# EAGLE design PCB_ESP32_v19_IMPRIMIR_COBRE (EAGLE 9.7.0)
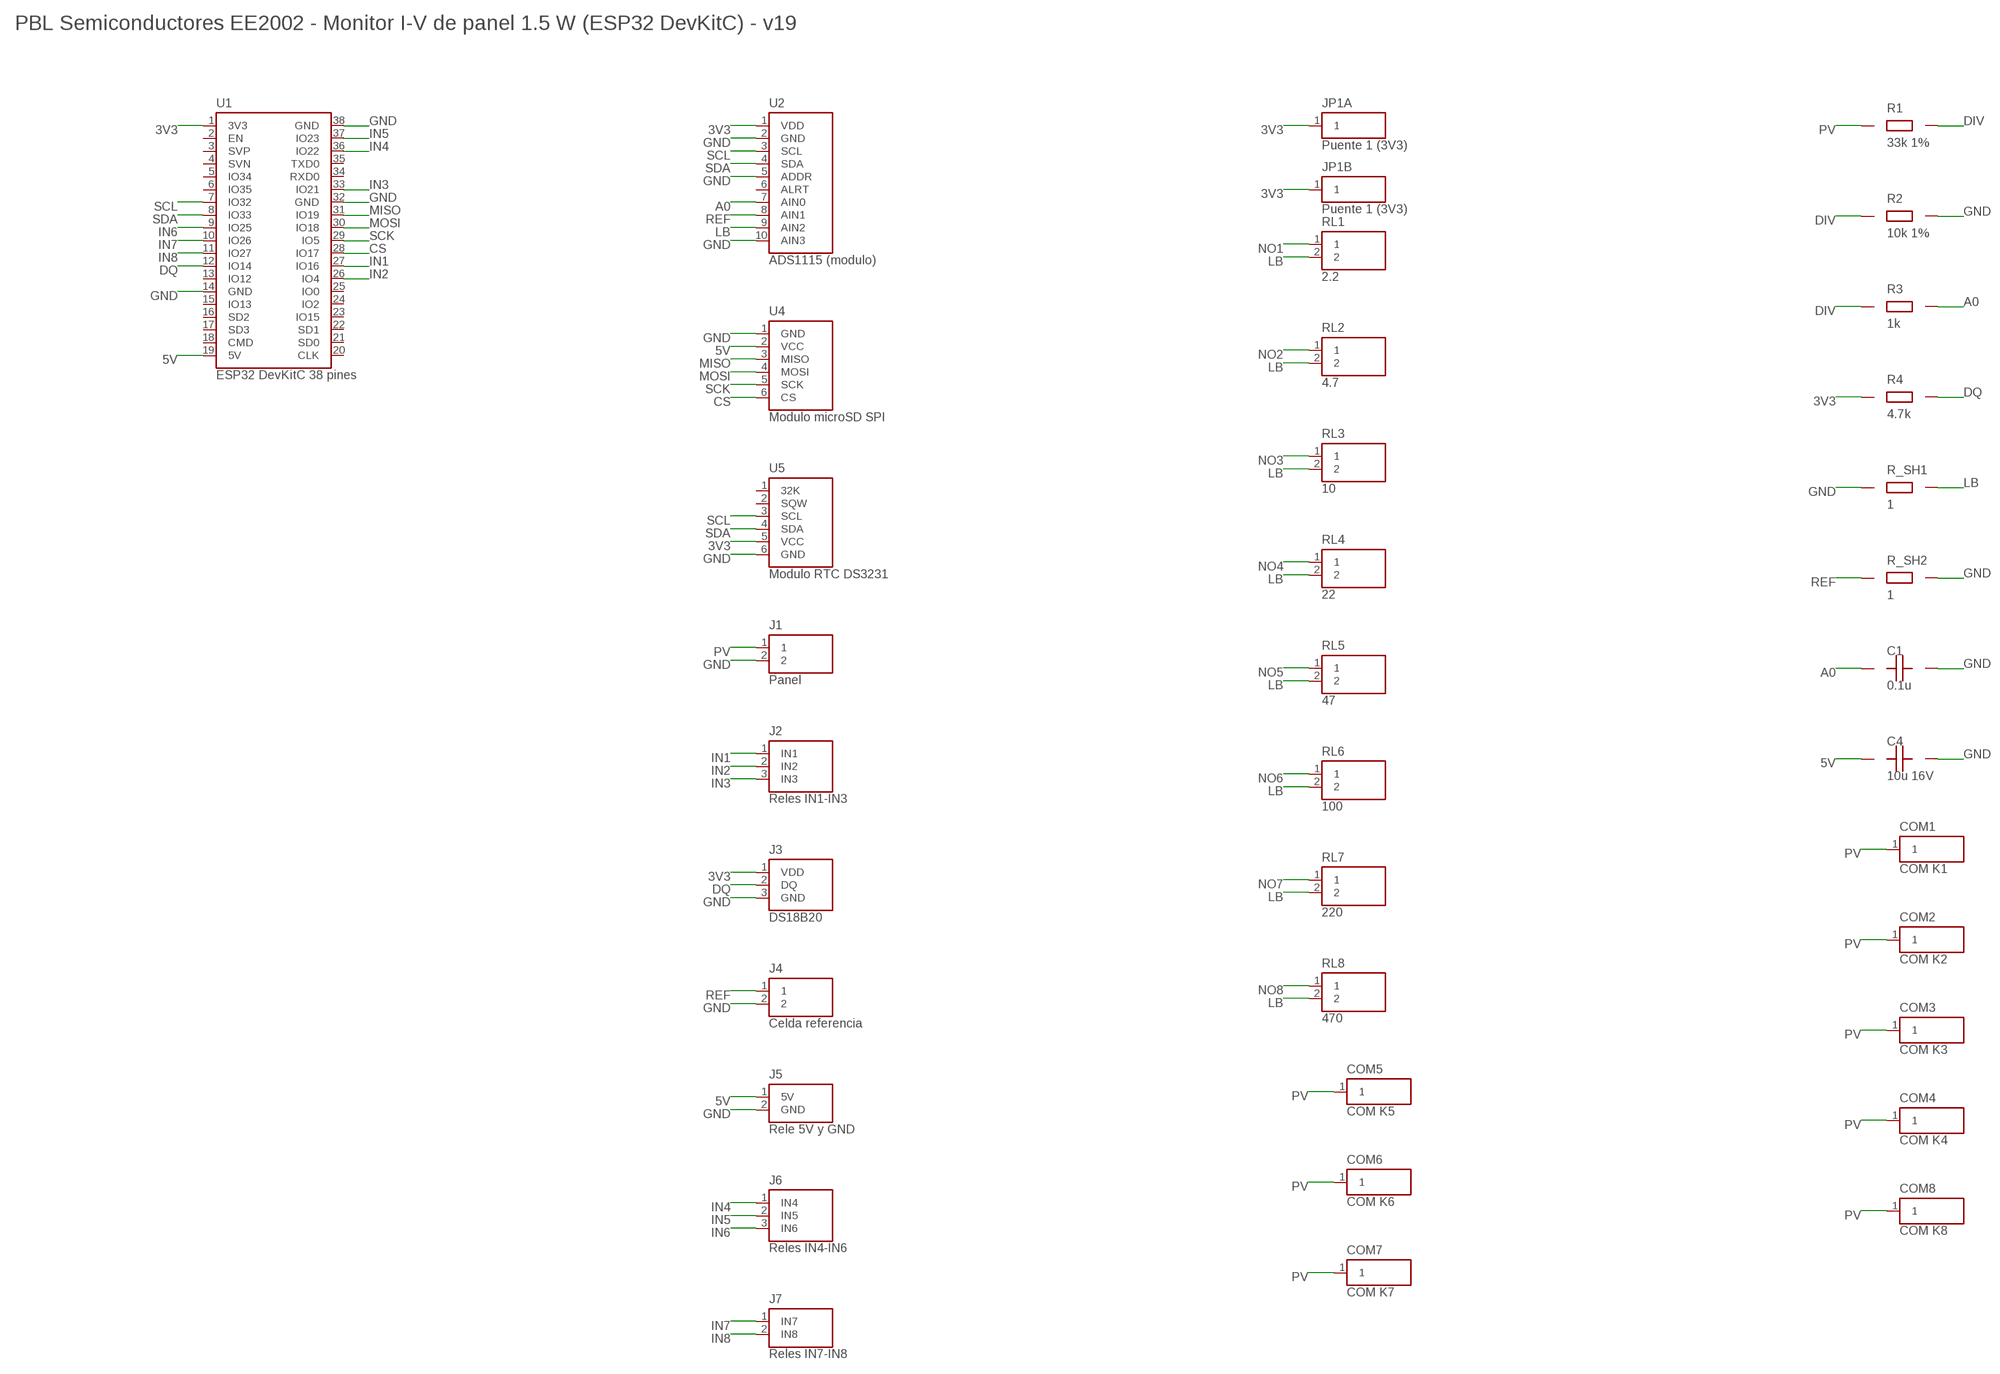
[diagram p0: schematic, sheet 1]

## Parts
C1  0.1u  C  [CAP_5MM]
C4  10u 16V  CP  [CAP_E_2_54]
COM1  COM K1  WIREPAD  [WIREPAD]
COM2  COM K2  WIREPAD  [WIREPAD]
COM3  COM K3  WIREPAD  [WIREPAD]
COM4  COM K4  WIREPAD  [WIREPAD]
COM5  COM K5  WIREPAD  [WIREPAD]
COM6  COM K6  WIREPAD  [WIREPAD]
COM7  COM K7  WIREPAD  [WIREPAD]
COM8  COM K8  WIREPAD  [WIREPAD]
J1  Panel  TERM2  [TERM2_5MM]
J2  Reles IN1-IN3  RELAY_L  [MALE_1X03]
J3  DS18B20  DS18B20_HDR  [MALE_1X03]
J4  Celda referencia  TERM2  [TERM2_5MM]
J5  Rele 5V y GND  RELAY_PWR  [MALE_1X02]
J6  Reles IN4-IN6  RELAY_RA  [MALE_1X03]
J7  Reles IN7-IN8  RELAY_RC  [MALE_1X02]
JP1A  Puente 1 (3V3)  JPAD  [JPAD]
JP1B  Puente 1 (3V3)  JPAD  [JPAD]
R1  33k 1%  R  [RES_V]
R2  10k 1%  R  [RES_V]
R3  1k  R  [RES_V]
R4  4.7k  R  [RES_V]
R_SH1  1  R  [RES_V]
R_SH2  1  R  [RES_V]
RL1  2.2  RLOAD  [RES_H_T]
RL2  4.7  RLOAD  [RES_H_T]
RL3  10  RLOAD  [RES_H_T]
RL4  22  RLOAD  [RES_H_T]
RL5  47  RLOAD  [RES_H_T]
RL6  100  RLOAD  [RES_H_T]
RL7  220  RLOAD  [RES_H_T]
RL8  470  RLOAD  [RES_H_T]
U1  ESP32 DevKitC 38 pines  ESP32  [ESP32_DEVKIT38]
U2  ADS1115 (modulo)  ADS1115  [SOCKET_1X10]
U4  Modulo microSD SPI  SDCARD  [SOCKET_1X06]
U5  Modulo RTC DS3231  DS3231  [SOCKET_1X06]

## Nets
3V3 [POWER]: J3.1(VDD) JP1A.1 JP1B.1 R4.1 U1.1(3V3) U2.1(VDD) U5.5(VCC)
5V [POWER]: C4.1(+) J5.1(5V) U1.19(5V) U4.2(VCC)
A0: C1.1 R3.2 U2.7(AIN0)
CS: U1.28(IO17) U4.6(CS)
DIV: R1.2 R2.1 R3.1
DQ: J3.2(DQ) R4.2 U1.12(IO14)
GND [POWER]: C1.2 C4.2(-) J1.2 J3.3(GND) J4.2 J5.2(GND) R2.2 R_SH1.1 R_SH2.2 U1.14(GND) U1.32(GND) U1.38(GND) U2.2(GND) U2.5(ADDR) U2.10(AIN3) U4.1(GND) U5.6(GND)
IN1: J2.1(IN1) U1.27(IO16)
IN2: J2.2(IN2) U1.26(IO4)
IN3: J2.3(IN3) U1.33(IO21)
IN4: J6.1(IN4) U1.36(IO22)
IN5: J6.2(IN5) U1.37(IO23)
IN6: J6.3(IN6) U1.9(IO25)
IN7: J7.1(IN7) U1.10(IO26)
IN8: J7.2(IN8) U1.11(IO27)
LB [POWER]: R_SH1.2 RL1.2 RL2.2 RL3.2 RL4.2 RL5.2 RL6.2 RL7.2 RL8.2 U2.9(AIN2)
MISO: U1.31(IO19) U4.3(MISO)
MOSI: U1.30(IO18) U4.4(MOSI)
NO1: RL1.1
NO2: RL2.1
NO3: RL3.1
NO4: RL4.1
NO5: RL5.1
NO6: RL6.1
NO7: RL7.1
NO8: RL8.1
PV [POWER]: COM1.1 COM2.1 COM3.1 COM4.1 COM5.1 COM6.1 COM7.1 COM8.1 J1.1 R1.1
REF: J4.1 R_SH2.1 U2.8(AIN1)
SCK: U1.29(IO5) U4.5(SCK)
SCL: U1.7(IO32) U2.3(SCL) U5.3(SCL)
SDA: U1.8(IO33) U2.4(SDA) U5.4(SDA)
Unconnected: U1.2(EN) U1.3(SVP) U1.4(SVN) U1.5(IO34) U1.6(IO35) U1.13(IO12) U1.15(IO13) U1.16(SD2) U1.17(SD3) U1.18(CMD) U1.20(CLK) U1.21(SD0) U1.22(SD1) U1.23(IO15) U1.24(IO2) U1.25(IO0) U1.34(RXD0) U1.35(TXD0) U2.6(ALRT) U5.1(32K) U5.2(SQW)

## Notes on the sheet
- PBL Semiconductores EE2002 - Monitor I-V de panel 1.5 W (ESP32 DevKitC) - v19

## Library data of the parts
C1 = PCB_PBL_Semiconductores:C
C4 = PCB_PBL_Semiconductores:CP
COM1-COM8 = PCB_PBL_Semiconductores:WIREPAD
J1 J4 = PCB_PBL_Semiconductores:TERM2
J2 = PCB_PBL_Semiconductores:RELAY_L
J3 = PCB_PBL_Semiconductores:DS18B20_HDR
J5 = PCB_PBL_Semiconductores:RELAY_PWR
J6 = PCB_PBL_Semiconductores:RELAY_RA
J7 = PCB_PBL_Semiconductores:RELAY_RC
JP1A JP1B = PCB_PBL_Semiconductores:JPAD
R1-R4 R_SH1 R_SH2 = PCB_PBL_Semiconductores:R
RL1-RL8 = PCB_PBL_Semiconductores:RLOAD
U1 = PCB_PBL_Semiconductores:ESP32
U2 = PCB_PBL_Semiconductores:ADS1115
U4 = PCB_PBL_Semiconductores:SDCARD
U5 = PCB_PBL_Semiconductores:DS3231

## Net classes
0 SIGNAL: width 0.254 mm, drill 0.381 mm, clearance 0.254 mm
1 POWER: width 0.381 mm, drill 0.508 mm, clearance 0.305 mm to class 0, clearance 0.305 mm

## Board
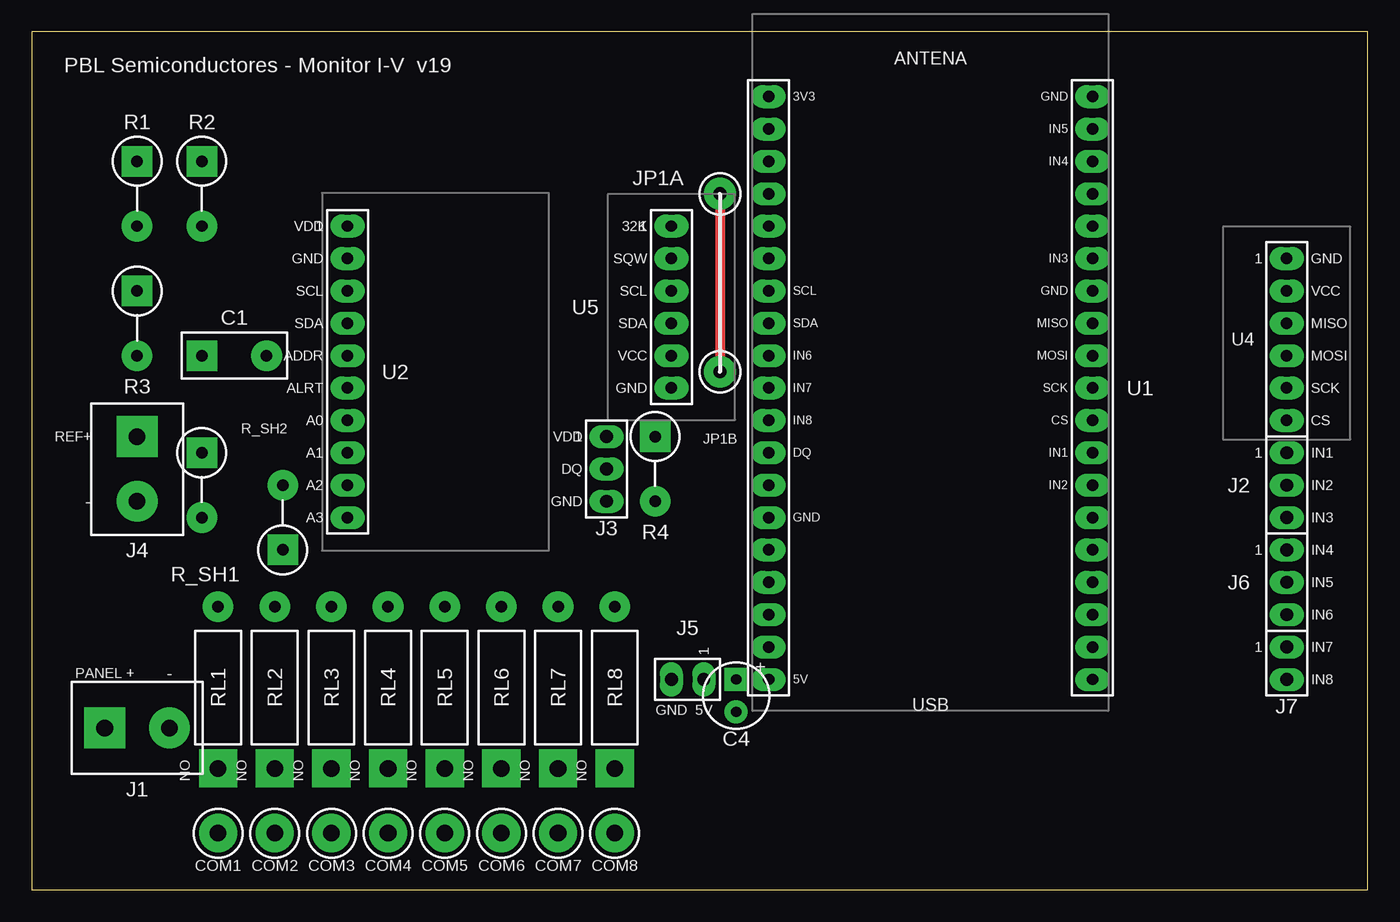
[diagram p1: board, top side]
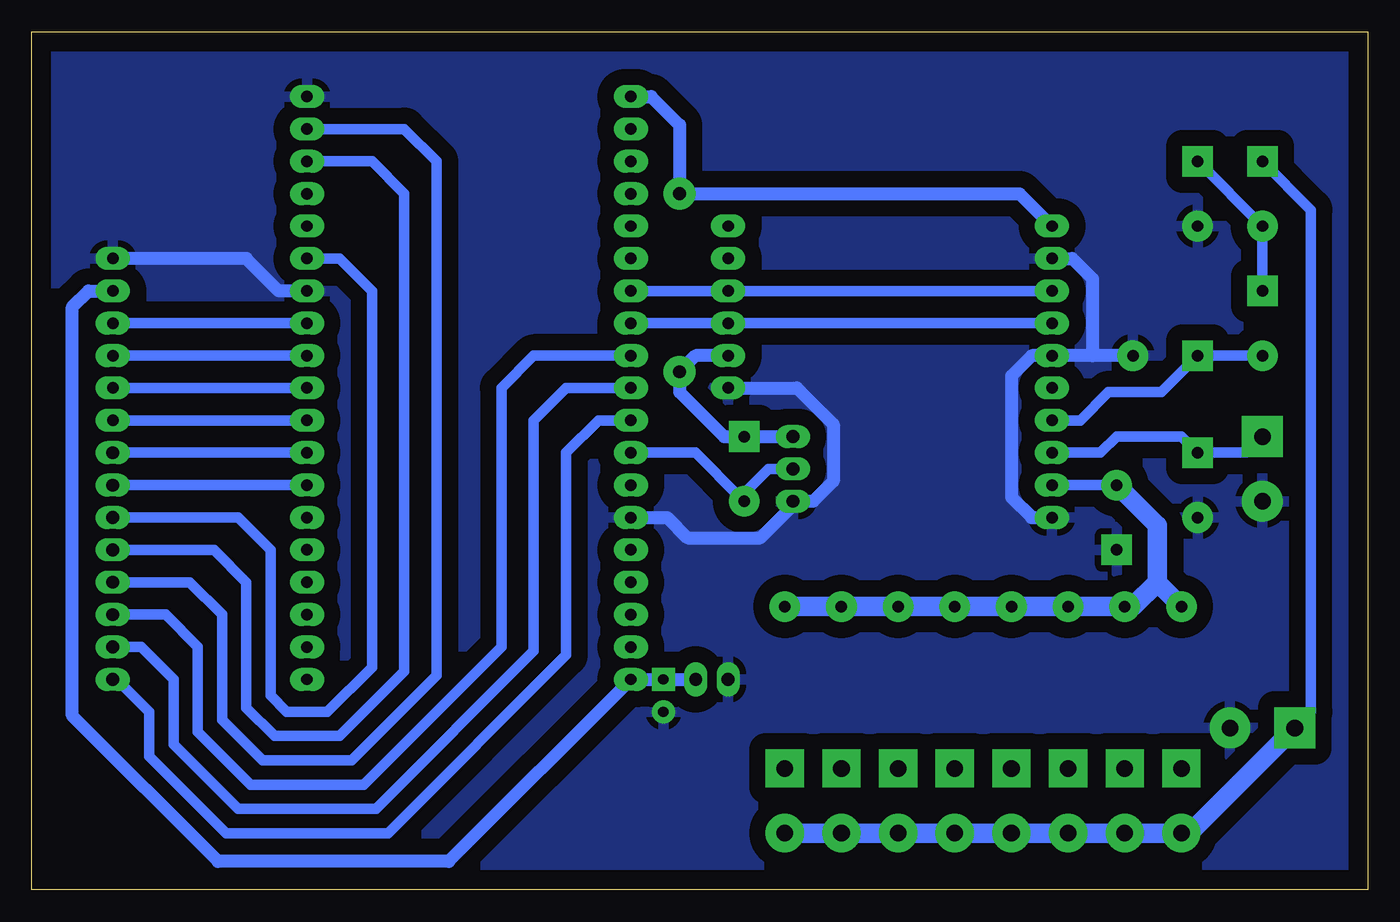
[diagram p2: board, bottom side, seen from below]

Size 104.78 x 67.31 mm. Coordinates in mm from the lower left corner, seen from the top.
Outline: 0,0 104.78,0 104.78,67.31 0,67.31 0,0
Copper layers (1*16): Top 0.035mm / dielectric 1.5mm / Bottom 0.035mm
Design rules "PBL v19 (mil, planchado / percloruro)": minimum track width 10mil, minimum drill 15mil, track to track 40mil, track to pad 40mil, pad to pad 20mil, via to via 20mil, smd to smd 6mil, copper to edge 60mil, drill to drill 6mil, minimum pad ring 0.4mm, minimum via ring 0.4mm, stop-mask expansion 4mil, vias tented up to drill 9999mil, thermal gap 20mil

### Footprints (pad centres in the part's own frame; a part is rotated, then mirrored left to right if it is on the bottom)
CAP_5MM = drill 0.9 pad 2.4 square: 1 0,0 | drill 0.9 pad 2.4 round: 2 5.08,0
CAP_E_2_54 = drill 0.8 pad 1.8 square: 1 0,0 | drill 0.8 pad 1.8 round: 2 2.54,0
WIREPAD = drill 1.3 pad 3 round: 1 0,0
TERM2_5MM = drill 1.3 pad 3.2 square: 1 0,0 | drill 1.3 pad 3.2 round: 2 5.08,0
MALE_1X03 = drill 1 pad 1.8 long: 1 0,0; 2 0,-2.54; 3 0,-5.08
MALE_1X02 = drill 1 pad 1.8 long: 1 0,0; 2 0,-2.54
JPAD = drill 1 pad 2.5 round: 1 0,0
RES_V = drill 0.9 pad 2.4 square: 1 0,0 | drill 0.9 pad 2.4 round: 2 5.08,0
RES_H_T = drill 1.3 pad 3 square: 1 0,0 | drill 0.9 pad 2.4 round: 2 12.7,0
ESP32_DEVKIT38 = drill 0.9 pad 1.8 long: 1 0,0; 2 0,-2.54; 3 0,-5.08; 4 0,-7.62; 5 0,-10.16; 6 0,-12.7; 7 0,-15.24; 8 0,-17.78; 9 0,-20.32; 10 0,-22.86; 11 0,-25.4; 12 0,-27.94; 13 0,-30.48; 14 0,-33.02; 15 0,-35.56; 16 0,-38.1; 17 0,-40.64; 18 0,-43.18; 19 0,-45.72; 20 25.4,-45.72; 21 25.4,-43.18; 22 25.4,-40.64; 23 25.4,-38.1; 24 25.4,-35.56; 25 25.4,-33.02; 26 25.4,-30.48; 27 25.4,-27.94; 28 25.4,-25.4; 29 25.4,-22.86; 30 25.4,-20.32; 31 25.4,-17.78; 32 25.4,-15.24; 33 25.4,-12.7; 34 25.4,-10.16; 35 25.4,-7.62; 36 25.4,-5.08; 37 25.4,-2.54; 38 25.4,0
SOCKET_1X10 = drill 0.9 pad 1.8 long: 1 0,0; 2 0,-2.54; 3 0,-5.08; 4 0,-7.62; 5 0,-10.16; 6 0,-12.7; 7 0,-15.24; 8 0,-17.78; 9 0,-20.32; 10 0,-22.86
SOCKET_1X06 = drill 0.9 pad 1.8 long: 1 0,0; 2 0,-2.54; 3 0,-5.08; 4 0,-7.62; 5 0,-10.16; 6 0,-12.7

### Placement (x,y rotation side)
C1  13.34,41.91 0 top
C4  55.24,16.51 270 top
COM1  14.61,4.45 0 top
COM2  19.05,4.45 0 top
COM3  23.5,4.45 0 top
COM4  27.94,4.45 0 top
COM5  32.38,4.45 0 top
COM6  36.83,4.45 0 top
COM7  41.27,4.45 0 top
COM8  45.72,4.45 0 top
J1  5.71,12.7 0 top
J2  98.42,34.29 0 top
J3  45.09,35.56 0 top
J4  8.26,35.56 270 top
J5  52.7,16.51 270 top
J6  98.42,26.67 0 top
J7  98.42,19.05 0 top
JP1A  53.98,54.61 0 top
JP1B  53.98,40.64 0 top
R1  8.26,57.15 270 top
R2  13.34,57.15 270 top
R3  8.26,46.99 270 top
R4  48.9,35.56 270 top
R_SH1  19.68,26.67 90 top
R_SH2  13.34,34.29 270 top
RL1  14.61,9.53 90 top
RL2  19.05,9.53 90 top
RL3  23.5,9.53 90 top
RL4  27.94,9.53 90 top
RL5  32.38,9.53 90 top
RL6  36.83,9.53 90 top
RL7  41.27,9.53 90 top
RL8  45.72,9.53 90 top
U1  57.78,62.23 0 top
U2  24.77,52.07 0 top
U4  98.42,49.53 0 top
U5  50.16,52.07 0 top

### Tracks (layer width: path | path; a pad name or v marks a point on that pad's centre or on a via)
3V3
  Top 0.8: JP1A.1 JP1B.1
  Bottom 1.016: U1.1 56.2,62.23 53.98,60.01 JP1A.1 27.3,54.61 U2.1 | U5.5 52.7,41.91 JP1B.1 53.98,39.05 50.48,35.56 R4.1 J3.1
5V
  Bottom 1.016: J5.1 C4.1 U1.19 72.07,2.22 90.17,2.22 101.6,13.65 101.6,45.72 100.33,46.99 U4.2
A0
  Bottom 0.813: U2.7 22.54,36.83 20.32,39.05 16.19,39.05 C1.1 R3.2
CS
  Bottom 0.813: U1.28 U4.6
DIV
  Bottom 0.813: R3.1 R1.2 R2.1
DQ
  Bottom 0.813: U1.12 52.7,34.29 49.21,30.8 | 49.21,30.8 R4.2 | 49.21,30.8 46.99,33.02 J3.2
GND
  Bottom 1.016: C1.2 21.59,41.91 | 21.59,41.91 U2.5 26.35,41.91 27.94,40.32 27.94,30.8 26.35,29.21 U2.10 | U2.2 23.18,49.53 21.59,47.94 21.59,41.91 | U1.14 54.93,29.21 53.34,27.62 47.62,27.62 45.09,30.16 J3.3 43.5,30.48 41.91,32.07 41.91,36.51 44.77,39.37 U5.6 | U1.32 85.41,46.99 87.95,49.53 U4.1
  pour Bottom (isolate 1.27): 0.5,0.5 104.28,0.5 104.28,66.81 0.5,66.81
IN1
  Bottom 0.813: U1.27 J2.1
IN2
  Bottom 0.813: U1.26 J2.2
IN3
  Bottom 0.813: U1.33 80.64,49.53 78.11,46.99 78.11,17.46 81.6,13.97 84.77,13.97 86.04,15.24 86.04,26.67 88.58,29.21 J2.3
IN4
  Bottom 0.813: U1.36 78.11,57.15 75.56,54.61 75.56,17.14 80.64,12.06 85.72,12.06 87.95,14.29 87.95,24.13 90.49,26.67 J6.1
IN5
  Bottom 0.813: U1.37 75.56,59.69 73.03,57.15 73.03,16.83 79.69,10.16 86.68,10.16 89.85,13.34 89.85,21.59 92.39,24.13 J6.2
IN6
  Bottom 0.813: U1.9 65.41,41.91 67.94,39.37 67.94,19.05 78.74,8.26 87.63,8.26 91.76,12.38 91.76,19.05 94.3,21.59 J6.3
IN7
  Bottom 0.813: U1.10 62.87,39.37 65.41,36.83 65.41,18.73 77.79,6.35 88.58,6.35 93.66,11.43 93.66,16.51 96.2,19.05 J7.1
IN8
  Bottom 0.813: U1.11 60.33,36.83 62.87,34.29 62.87,18.41 76.83,4.45 89.53,4.45 95.57,10.48 95.57,13.97 98.11,16.51 J7.2
LB
  Bottom 0.813: U2.9 R_SH1.2
  Bottom 1.524: R_SH1.2 16.51,28.57 16.51,24.13 | 16.51,24.13 RL1.2 | 16.51,24.13 18.41,22.23 RL2.2 RL3.2 RL4.2 RL5.2 RL6.2 RL7.2 RL8.2
MISO
  Bottom 0.813: U1.31 U4.3
MOSI
  Bottom 0.813: U1.30 U4.4
PV
  Bottom 0.813: J1.1 4.45,13.97 4.45,53.34 R1.1
  Bottom 1.524: J1.1 13.97,4.45 COM1.1 COM2.1 COM3.1 COM4.1 COM5.1 COM6.1 COM7.1 COM8.1
REF
  Bottom 0.813: U2.8 20.95,34.29 19.68,35.56 14.61,35.56 R_SH2.1 9.53,34.29 J4.1
SCK
  Bottom 0.813: U1.29 U4.5
SCL
  Bottom 0.813: U1.7 U5.3 U2.3
SDA
  Bottom 0.813: U1.8 U5.4 U2.4

### Text on the board
tPlace: PBL Semiconductores - Monitor I-V v19 | 3V3 | GND | IN5 | IN4 | VDD | 32K | GND | SQW | IN3 | GND | SCL | SCL | SCL | GND | VCC | SDA | SDA | SDA | MISO | MISO | ADDR | VCC | IN6 | MOSI | MOSI | ALRT | GND | IN7 | SCK | SCK | A0 | IN8 | CS | CS | REF+ | VDD | A1 | DQ | IN1 | IN1 | DQ | A2 | IN2 | IN2 | - | GND | A3 | GND | IN3 | IN4 | IN5 | IN6 | IN7 | PANEL + | - | 5V | IN8 | GND | 5V
tDocu: ADS1115 (modulo plano, 28x17.8) | RTC parado (pines en L) | microSD parada